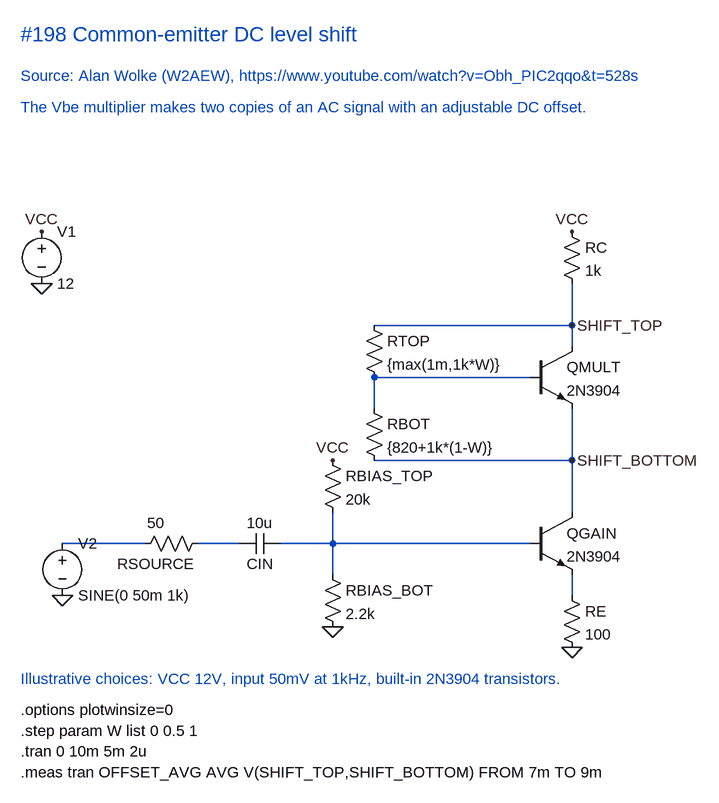
[diagram p0: schematic Common-emitter DC level shift.asc]
Common-emitter DC level shift.asc, the LTspice schematic file:
Version 4.1
SHEET 1 1250 1050
WIRE 256 608 128 608
WIRE 400 608 336 608
WIRE 544 608 464 608
WIRE 848 608 544 608
WIRE 544 608 544 560
WIRE 544 656 544 608
WIRE 912 272 912 208
WIRE 912 304 912 272
WIRE 912 272 608 272
WIRE 848 352 608 352
WIRE 608 400 608 352
WIRE 912 480 912 400
WIRE 912 480 608 480
WIRE 912 560 912 480
WIRE 912 688 912 656
FLAG 96 128 VCC
FLAG 96 208 0
FLAG 128 688 0
FLAG 544 480 VCC
FLAG 544 736 0
FLAG 912 128 VCC
FLAG 912 768 0
FLAG 912 272 SHIFT_TOP
FLAG 912 480 SHIFT_BOTTOM
SYMBOL voltage 96 112 R0
SYMATTR InstName V1
SYMATTR Value 12
SYMBOL voltage 128 592 R0
SYMATTR InstName V2
SYMATTR Value SINE(0 50m 1k)
SYMBOL res 240 624 R270
WINDOW 0 0 32 VBottom 2
WINDOW 3 32 32 VTop 2
SYMATTR InstName RSOURCE
SYMATTR Value 50
SYMBOL cap 400 624 R270
WINDOW 0 0 32 VBottom 2
WINDOW 3 32 32 VTop 2
SYMATTR InstName CIN
SYMATTR Value 10u
SYMBOL res 528 464 R0
SYMATTR InstName RBIAS_TOP
SYMATTR Value 20k
SYMBOL res 528 640 R0
SYMATTR InstName RBIAS_BOT
SYMATTR Value 2.2k
SYMBOL npn 848 560 R0
SYMATTR InstName QGAIN
SYMATTR Value 2N3904
SYMBOL res 896 672 R0
SYMATTR InstName RE
SYMATTR Value 100
SYMBOL res 896 112 R0
SYMATTR InstName RC
SYMATTR Value 1k
SYMBOL npn 848 304 R0
SYMATTR InstName QMULT
SYMATTR Value 2N3904
SYMBOL res 592 256 R0
SYMATTR InstName RTOP
SYMATTR Value {max(1m,1k*W)}
SYMBOL res 592 384 R0
SYMATTR InstName RBOT
SYMATTR Value {820+1k*(1-W)}
TEXT 64 -176 Left 3 ;#198 Common-emitter DC level shift
TEXT 64 -112 Left 2 ;Source: Alan Wolke (W2AEW), https://www.youtube.com/watch?v=Obh_PIC2qqo&t=528s
TEXT 64 -64 Left 2 ;The Vbe multiplier makes two copies of an AC signal with an adjustable DC offset.
TEXT 64 816 Left 2 ;Illustrative choices: VCC 12V, input 50mV at 1kHz, built-in 2N3904 transistors.
TEXT 64 864 Left 2 !.options plotwinsize=0
TEXT 64 896 Left 2 !.step param W list 0 0.5 1
TEXT 64 928 Left 2 !.tran 0 10m 5m 2u
TEXT 64 960 Left 2 !.meas tran OFFSET_AVG AVG V(SHIFT_TOP,SHIFT_BOTTOM) FROM 7m TO 9m

The netlist it stands for:
* Common-emitter DC level shift.asc
V1 VCC 0 12
V2 N001 0 SINE(0 50m 1k)
RSOURCE N001 N002 50
CIN N002 N003 10u
RBIAS_TOP VCC N003 20k
RBIAS_BOT N003 0 2.2k
QGAIN SHIFT_BOTTOM N003 N005 0 2N3904
RE N005 0 100
RC VCC SHIFT_TOP 1k
QMULT SHIFT_TOP N004 SHIFT_BOTTOM 0 2N3904
RTOP SHIFT_TOP N004 {max(1m,1k*W)}
RBOT N004 SHIFT_BOTTOM {820+1k*(1-W)}
.model NPN NPN
.model PNP PNP
.lib standard.bjt
* #198 Common-emitter DC level shift
* Source: Alan Wolke (W2AEW), https://www.youtube.com/watch?v=Obh_PIC2qqo&t=528s
* The Vbe multiplier makes two copies of an AC signal with an adjustable DC offset.
* Illustrative choices: VCC 12V, input 50mV at 1kHz, built-in 2N3904 transistors.
.options plotwinsize=0
.step param W list 0 0.5 1
.tran 0 10m 5m 2u
.meas tran OFFSET_AVG AVG V(SHIFT_TOP,SHIFT_BOTTOM) FROM 7m TO 9m
.backanno
.end